# Altium schematic sheet USB_Host.SchDoc
size A; Author: Jared Ainsworth; CompanyName: UpRev LLC; Engineer: Jared Ainsworth; Organization: UpRev LLC; Address1: 4807 Commercial Park Dr.; Address2: Austin, TX 78724; Address3: United States; Address4: www.UpRev.com; SheetNumber: 3; SheetTotal: 13
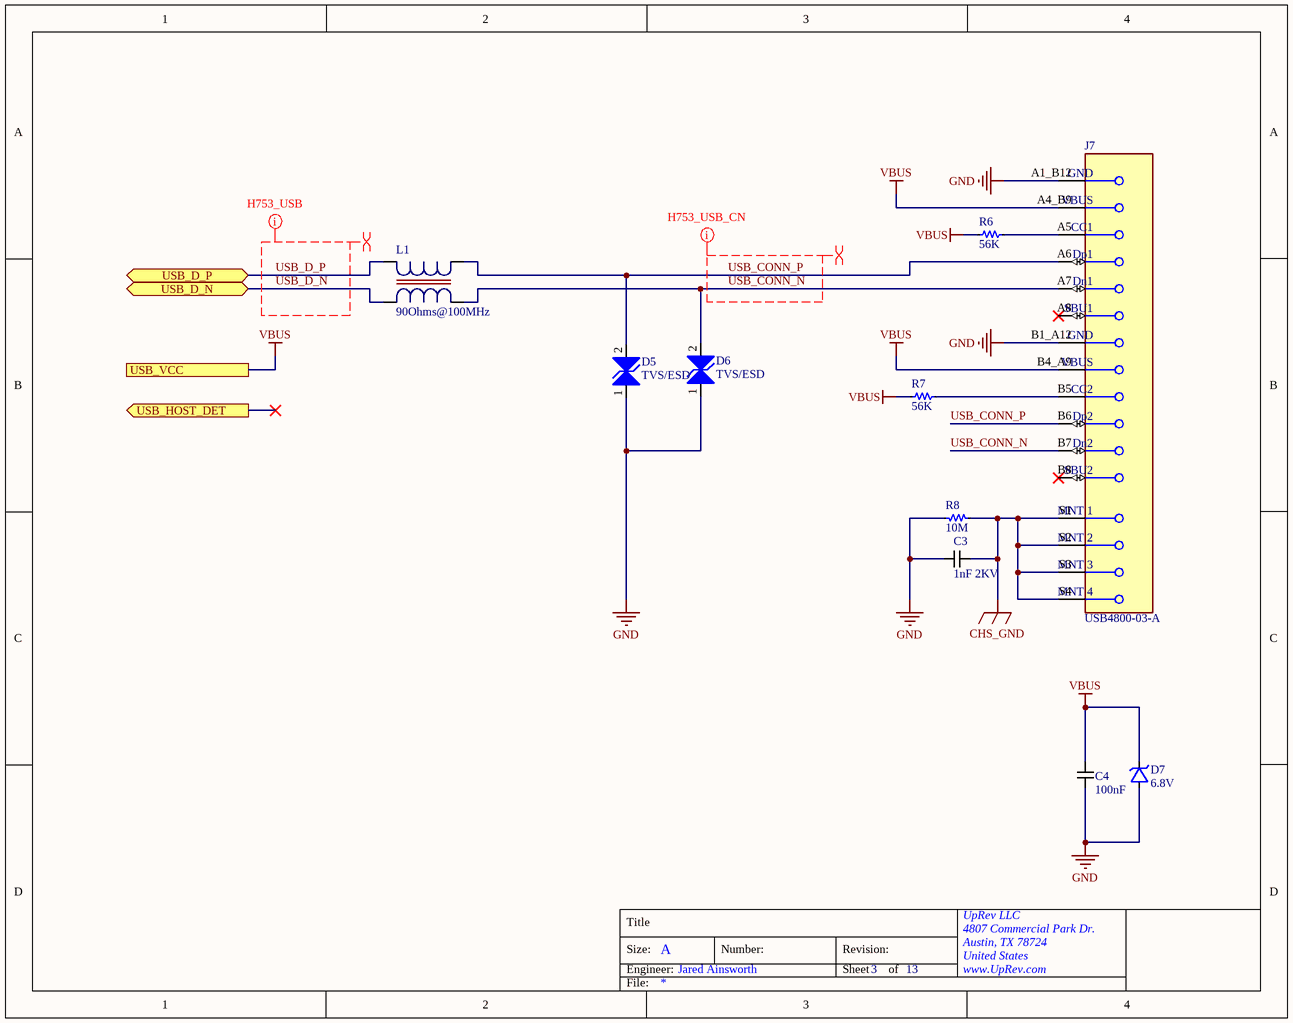
[diagram p0: USB_Host.SchDoc]

## Parts
C3  1nF 2KV  [C1206 (3216)]
C4  100nF  [C0402 (1005)]
D5  TVS/ESD  [R0402 (1005)]
D6  TVS/ESD  [R0402 (1005)]
D7  6.8V  [DO-214AC]
J7  USB4800-03-A  [Connector USB C Raised USB4800-03-A]
L1  value 90Ohms@100MHz  [INDUCTOR MCZ1210AH TDK]  (hidden comment: CMC 100MA 2LN 90 OHM SMD)
R6  56K  [R0402 (1005)]
R7  56K  [R0402 (1005)]
R8  10M  [R0805 (2012)]

## Ports
USB_D_N (bidir, see Top_Level[2C], Dev_Board_Connection[2C]), USB_D_P (bidir, see Top_Level[2C], Dev_Board_Connection[2C]), USB_HOST_DET (out, see Top_Level[2C], Dev_Board_Connection[2C]), USB_VCC (see Top_Level[2C], Dev_Board_Connection[2C])

## Nets
CHS_GND: C3.1 J7.S1(MNT_1) J7.S2(MNT_2) J7.S3(MNT_3) J7.S4(MNT_4) R8.1
GND: C3.2 C4.2 D5.1 D6.1 D7.2(Anode) J7.A1_B12(GND) J7.B1_A12(GND) R8.2
VBUS: C4.1 D7.1(Cathode) J7.A4_B9(VBUS) J7.B4_A9(VBUS) R6.1 R7.1 ; port USB_VCC
USB_CONN_N: D6.2 J7.A7(Dn1) J7.B7(Dn2) L1.2
USB_CONN_P: D5.2 J7.A6(Dp1) J7.B6(Dp2) L1.1
USB_D_N: L1.3 ; port USB_D_N
USB_D_P: L1.4 ; port USB_D_P
NetJ7_A5: J7.A5(CC1) R6.2
NetJ7_B5: J7.B5(CC2) R7.2

Not connected (* = marked no-connect by the designer): J7 A8(SBU1)* B8(SBU2)*

## Layout directives
differential pair; differential pair class ZDIFF90: USB_CONN_N, USB_CONN_P, USB_D_N, USB_D_P
net class H753_USB_CN: USB_CONN_N, USB_CONN_P
net class H753_USB: USB_D_N, USB_D_P

## Notes on the sheet
- Title
- Size:
- Engineer:
- A
- Number:
- Revision:
- Sheet
- of
- File:

## Library data of the parts
C3 = 1nF Ceramic, 2KV, X7R, 1206 (3216): 1nF Ceramic Capacitor, 2KV, X7R, ±10%, 1206 (3216); Manufacturer Part Number: CC1206KKX7RDBB102; Manufacturer: YAGEO; Package: 1206 (3216 metric); Value: 1nF 2KV; LCSC Part Number: C23631
C4 = 100nF Ceramic, 16V, 0402 (1005): 100nF Ceramic Capacitor, 16V, X7R, ±10%, 0402 (1005); Manufacturer Part Number: CL05B104KO5NNNC; Manufacturer: Samsung Electro-Mechanics; Package: 0402 (1005 metric); LCSC Part Number: C1525; Value: 100nF
D5 D6 = SESD0402X1BN-0010-098: 7V TVS Bidirectional, ESD Suppressors; Manufacturer: Littelfuse; Geometry.Height: 0.43mm; Manufacturer Part Number: SESD0402X1BN-0010-098; Value: TVS/ESD; LCSC Part Number: C2763588; Package: 0402
D7 = 1SMA4736A: 6.8V Zener Diode; Manufacturer: MDD(Microdiode Semiconductor); Package: SMA(DO-214AC); Manufacturer Part Number: 1SMA4736A; LCSC Part Number: C2858511
J7 = USB4800-03-A: CONN USB 2.0 TYPE-C R/A SMT RAISED; Manufacturer: Global Connector Technology; Package: SMD; Manufacturer Part Number: USB4800-03-A; LCSC Part Number: C5352763
L1 = MCZ1210AH900L2T: 2 Line Common Mode Choke Surface Mount 90 Ohms @ 100 MHz 100mA DCR 1.75Ohm; Manufacturer Part Number: MCZ1210AH900L2TA0G; Manufacturer: TDK; LCSC Part Number: C114784; Package: SMD-4P,1.2x1mm
R6 R7 = 56K ohm, 0402 (1005): 56K ohm, Resistor, ±1%, 0402 (1005); Manufacturer: UNI-ROYAL(Uniroyal Elec); Manufacturer Part Number: 0402WGF5602TCE; Package: 0402 (1005 metric); LCSC Part Number: C25796; Value: 56K
R8 = 10M ohm, 0805 (2012): 10M ohm, Resistor, ±1%, 0805 (2012); Manufacturer: UNI-ROYAL(Uniroyal Elec); Manufacturer Part Number: 0805W8F1005T5E; Package: 0805 (2012 metric); LCSC Part Number: C26108; Value: 10M